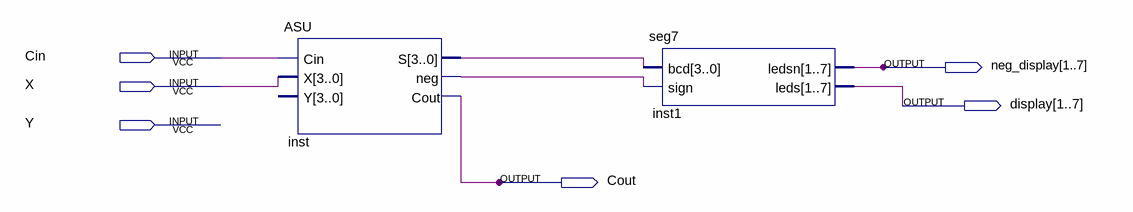
[diagram p0: schematic sheet]
// Quartus schematic Block1.bdf as structural Verilog: 2 symbols, 6 pins
module Block1 (
  input  Cin,
  input  X,
  input  Y,
  output [1:7] neg_display,
  output [1:7] display,
  output Cout
);

  wire inst_neg;
  wire [3:0] inst_s;

  ASU inst (.Cin(Cin), .X({4{X}}), .S(inst_s), .neg(inst_neg), .Cout(Cout));  // open: Y
  seg7 inst1 (.bcd(inst_s), .sign(inst_neg), .ledsn(neg_display), .leds(display));
endmodule
